# Altium schematic sheet s3-sdr.SchDoc
size 420 x 297 mm; SheetNumber: 2; SheetTotal: 9
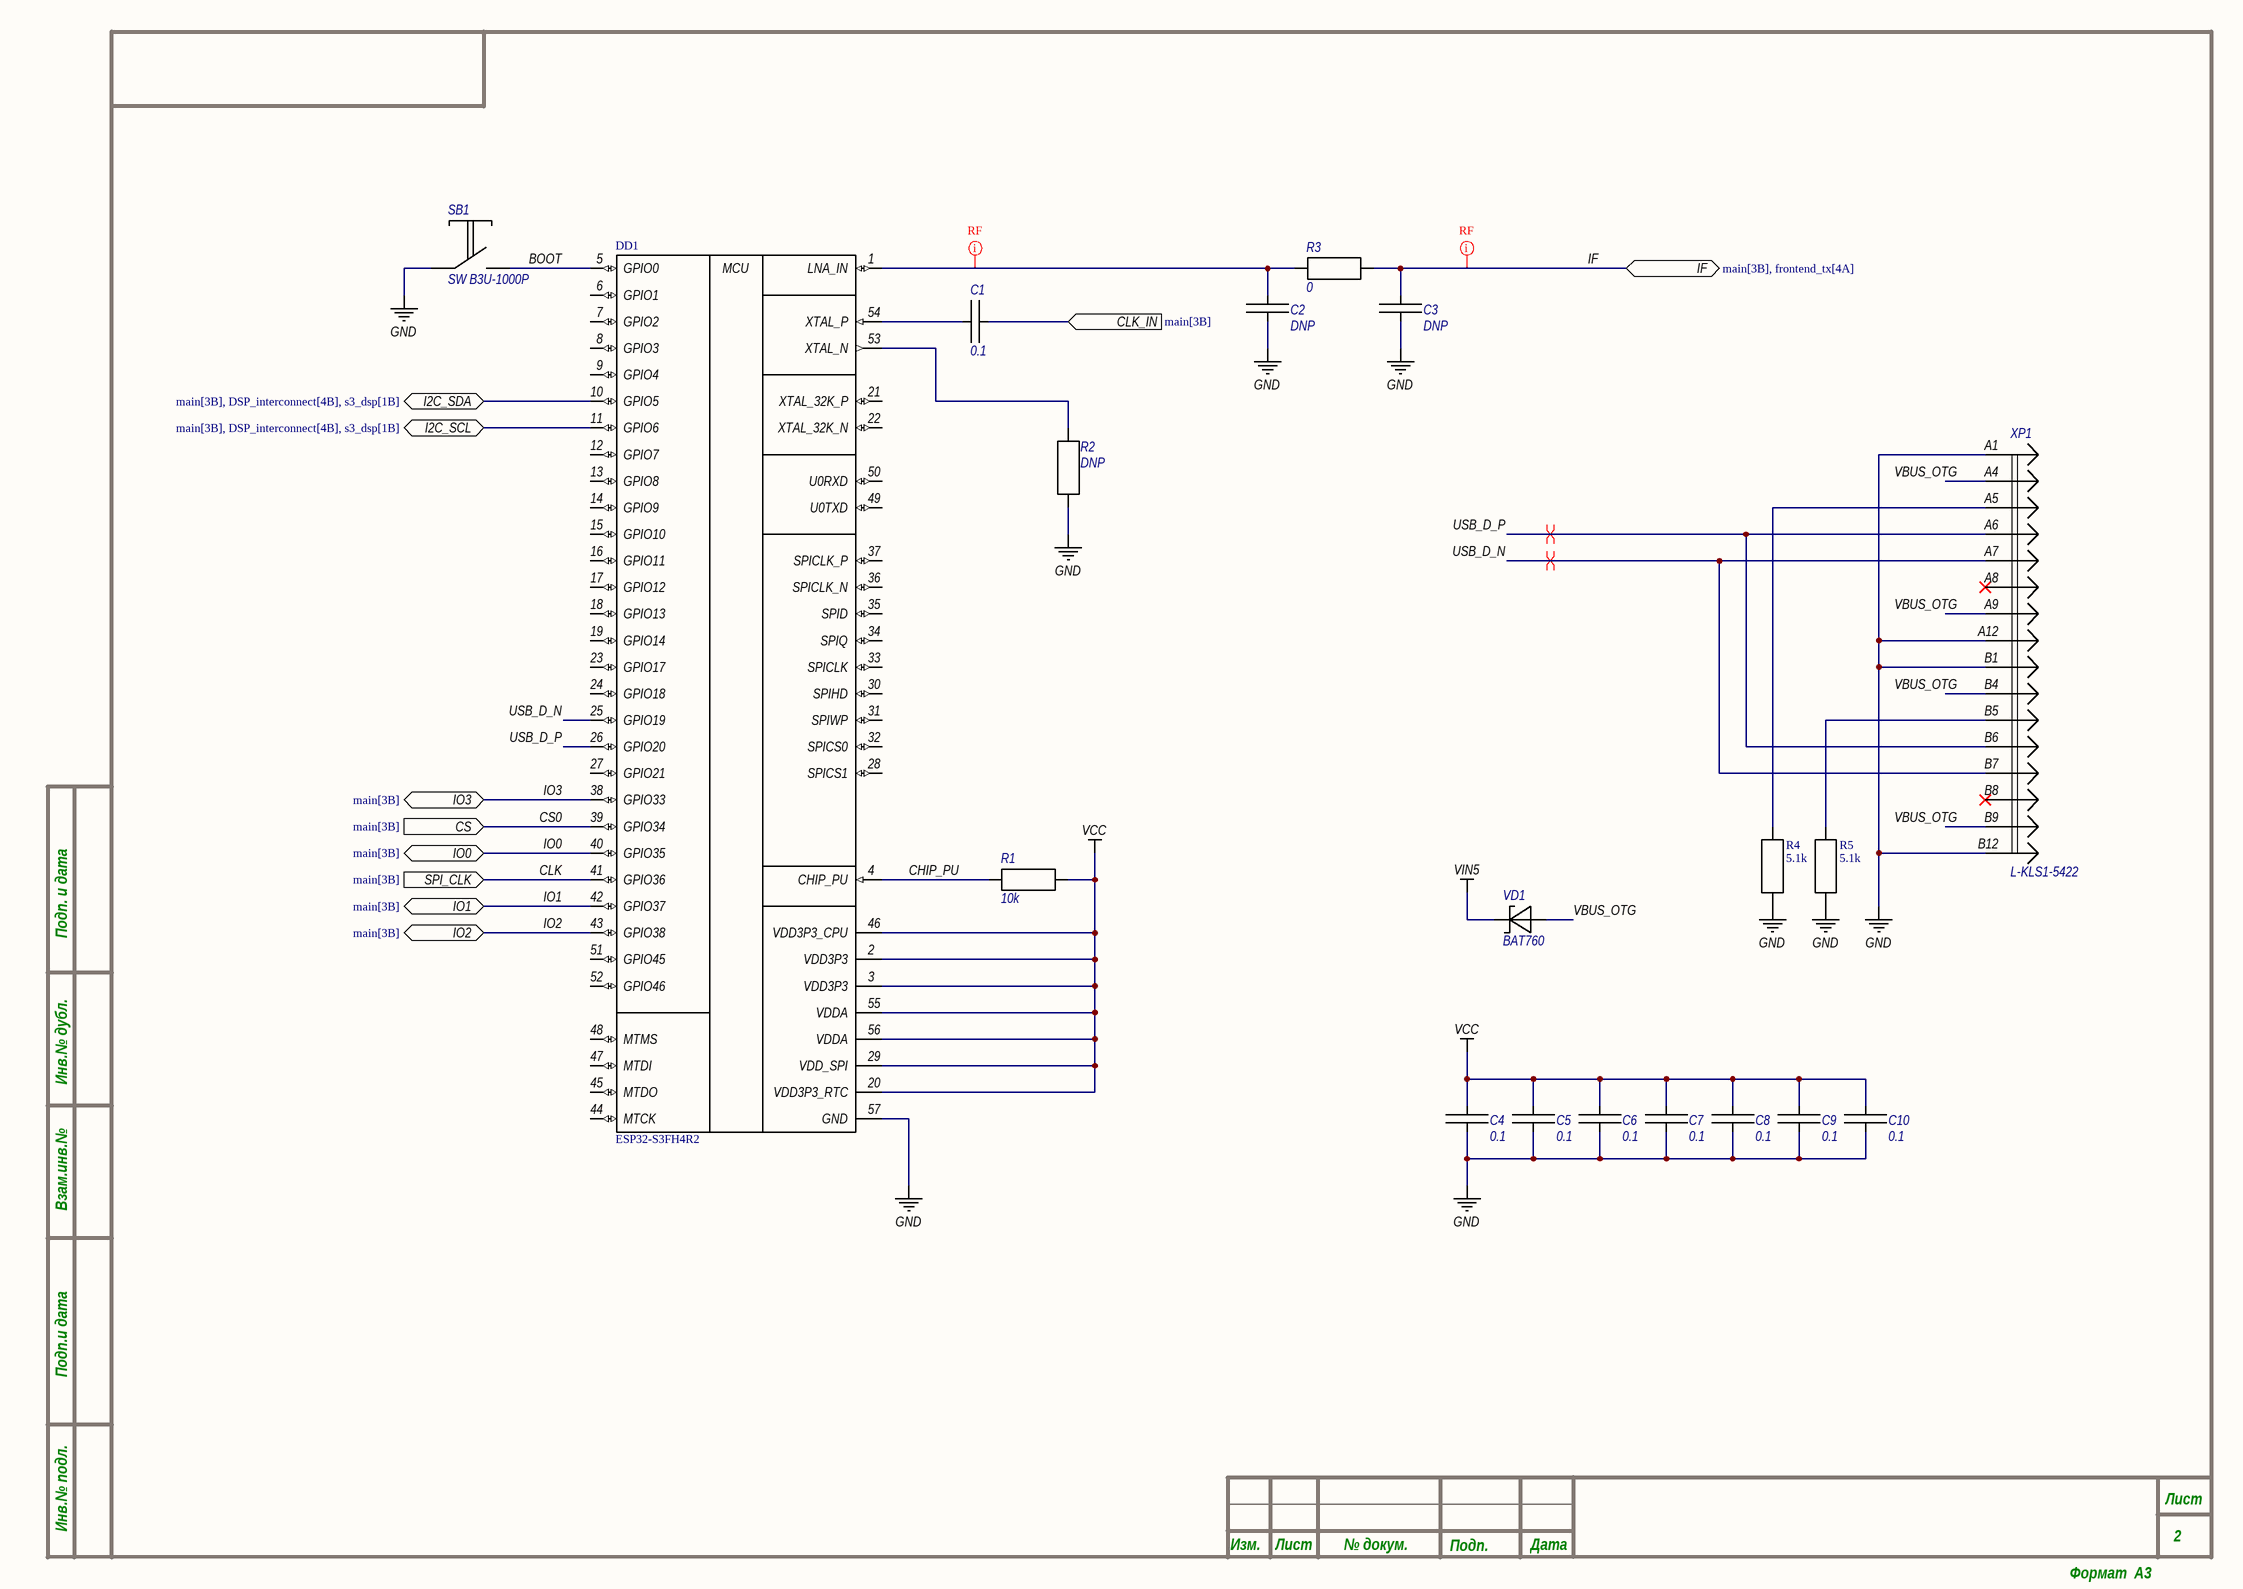
[diagram p0: s3-sdr.SchDoc]

## Parts
C1  0.1  [C0805C]
C2  DNP  [C0402C]
C3  DNP  [C0402C]
C4  0.1  [C0805C]
C5  0.1  [C0805C]
C6  0.1  [C0805C]
C7  0.1  [C0805C]
C8  0.1  [C0805C]
C9  0.1  [C0805C]
C10  0.1  [C0805C]
DD1  ESP32-S3FH4R2  [QFN56_7X7_EXP-M]
R1  10k  [C0805R]
R2  DNP  [C0603R]
R3  0  [C0402R]
R4  5.1k  [C0805R]
R5  5.1k  [C0805R]
SB1  SW B3U-1000P  [SW_B3U-1000P]
VD1  BAT760  [SOD123]
XP1  L-KLS1-5422  [L-KLS1-5422]

## Ports
CLK_IN (in, see main[3B]), CS (in, see main[3B]), I2C_SCL (bidir, see main[3B], DSP_interconnect[4B], s3_dsp[1B]), I2C_SDA (bidir, see main[3B], DSP_interconnect[4B], s3_dsp[1B]), IF (bidir, see main[3B], frontend_tx[4A]), IO0 (bidir, see main[3B]), IO1 (bidir, see main[3B]), IO2 (bidir, see main[3B]), IO3 (bidir, see main[3B]), SPI_CLK (in, see main[3B])

## Nets
GND: C2.1 C3.1 C4.2 C5.2 C6.2 C7.2 C8.2 C9.2 C10.2 DD1.57(GND) R2.2 R4.2 R5.2 SB1.1 XP1.A1 XP1.A12 XP1.B1 XP1.B12
VCC: C4.1 C5.1 C6.1 C7.1 C8.1 C9.1 C10.1 DD1.2(VDD3P3) DD1.3(VDD3P3) DD1.20(VDD3P3_RTC) DD1.29(VDD_SPI) DD1.46(VDD3P3_CPU) DD1.55(VDDA) DD1.56(VDDA) R1.1
VIN5: VD1.C
BOOT: DD1.5(GPIO0) SB1.2
CHIP_PU: DD1.4(CHIP_PU) R1.2
CLK: DD1.41(GPIO36) ; port SPI_CLK
CLK_IN: C1.2 ; port CLK_IN
CS0: DD1.39(GPIO34) ; port CS
I2C_SCL: DD1.11(GPIO6) ; port I2C_SCL
I2C_SDA: DD1.10(GPIO5) ; port I2C_SDA
IF: C3.2 R3.1 ; port IF
IO0: DD1.40(GPIO35) ; port IO0
IO1: DD1.42(GPIO37) ; port IO1
IO2: DD1.43(GPIO38) ; port IO2
IO3: DD1.38(GPIO33) ; port IO3
USB_D_N: DD1.25(GPIO19) XP1.A7 XP1.B7
USB_D_P: DD1.26(GPIO20) XP1.A6 XP1.B6
VBUS_OTG: VD1.A XP1.A4 XP1.A9 XP1.B4 XP1.B9
NetC1_1: C1.1 DD1.54(XTAL_P)
NetC2_2: C2.2 DD1.1(LNA_IN) R3.2
NetDD1_53: DD1.53(XTAL_N) R2.1
NetR4_1: R4.1 XP1.A5
NetR5_1: R5.1 XP1.B5

Not connected (* = marked no-connect by the designer): DD1 6(GPIO1) 7(GPIO2) 8(GPIO3) 9(GPIO4) 12(GPIO7) 13(GPIO8) 14(GPIO9) 15(GPIO10) 16(GPIO11) 17(GPIO12) 18(GPIO13) 19(GPIO14) 21(XTAL_32K_P) 22(XTAL_32K_N) 23(GPIO17) 24(GPIO18) 27(GPIO21) 28(SPICS1) 30(SPIHD) 31(SPIWP) 32(SPICS0) 33(SPICLK) 34(SPIQ) 35(SPID) 36(SPICLK_N) 37(SPICLK_P) 44(MTCK) 45(MTDO) 47(MTDI) 48(MTMS) 49(U0TXD) 50(U0RXD) 51(GPIO45) 52(GPIO46); XP1 A8* B8*

## Layout directives
net class RF: IF, NetC2_2
differential pair: USB_D_N, USB_D_P

## Notes on the sheet
- Подп. и дата
- Инв.№ дубл.
- Взам.инв.№
- Подп.и дата
- Инв.№ подл.
- Изм.
- Лист
- № докум.
- Подп.
- Дата
- Формат  A3
- (in symbol ESP32-S3) MCU

## Library data of the parts
C1-C10 = Cap
  C1 C4-C10: Value: 0.1
  C2 C3: Value: DNP
DD1 = ESP32-S3: Description; Manufacturer_Name: Espressif Systems; Copyright: Copyright (C) 2025 Ultra Librarian. All rights reserved.; Manufacturer_Part_Number: ESP32-S3; RefDes: RefDes; Type: Type
R1-R3 = res
  R1: Value: 10k
  R2: Value: DNP
  R3: Value: 0
R4 R5 = res: MAPPING: 2(1,2,100)(1,2,100); Value: 5.1k; TYPE: Resistor
SB1 = SW-PB: Part number: SW B3U-1000P
VD1 = Shotktky Diode: Part number: BAT760
XP1 = L-KLS1-5422: Стандарт USB 3.1 , Тип стандарта Type C , Монтаж На плату, SMD , Тип разъема Розетка , Количество портов 1 , Расположение контактов Прямое; Part number: L-KLS1-5422